# Altium schematic sheet FPGA_Core.SchDoc
size A4; SheetNumber: 3; SheetTotal: 5
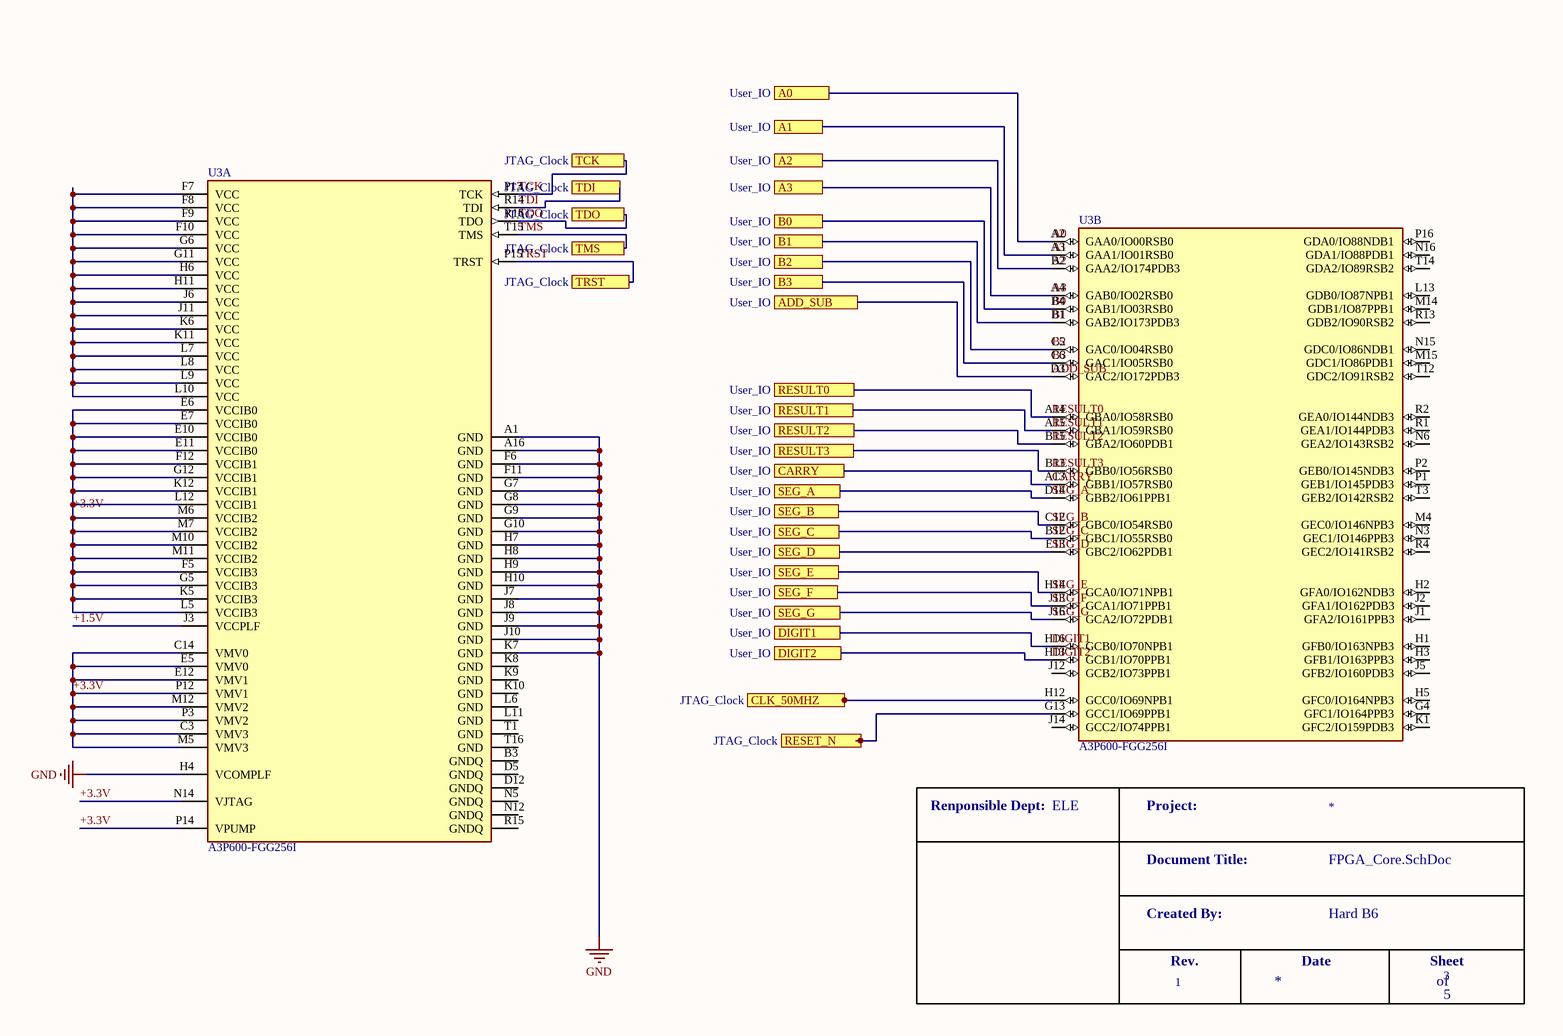
[diagram p0: FPGA_Core.SchDoc]

## Parts
*  HSHL Title Block  (value not drawn)  (graphical)
U3  A3P600-FGG256I  [FP-FG256-MFG]  (parts A,B of 4)

## Ports
A0 (see User_IO), A1 (see User_IO), A2 (see User_IO), A3 (see User_IO), ADD_SUB (see User_IO), B0 (see User_IO), B1 (see User_IO), B2 (see User_IO), B3 (see User_IO), CARRY (see User_IO), CLK_50MHZ (see JTAG_Clock), DIGIT1 (see User_IO), DIGIT2 (see User_IO), RESET_N (see JTAG_Clock), RESULT0 (see User_IO), RESULT1 (see User_IO), RESULT2 (see User_IO), RESULT3 (see User_IO), SEG_A (see User_IO), SEG_B (see User_IO), SEG_C (see User_IO), SEG_D (see User_IO), SEG_E (see User_IO), SEG_F (see User_IO), SEG_G (see User_IO), TCK (see JTAG_Clock), TDI (see JTAG_Clock), TDO (see JTAG_Clock), TMS (see JTAG_Clock), TRST (see JTAG_Clock)

## Nets
GND: U3.A1(GND) U3.A16(GND) U3.F6(GND) U3.F11(GND) U3.G7(GND) U3.G8(GND) U3.G9(GND) U3.G10(GND) U3.H4(VCOMPLF) U3.H7(GND) U3.H8(GND) U3.H9(GND) U3.H10(GND) U3.J7(GND) U3.J8(GND) U3.J9(GND) U3.J10(GND) U3.K7(GND)
+1.5V: U3.J3(VCCPLF)
+3.3V: U3.C3(VMV3) U3.C14(VMV0) U3.E5(VMV0) U3.E6(VCCIB0) U3.E7(VCCIB0) U3.E10(VCCIB0) U3.E11(VCCIB0) U3.E12(VMV1) U3.F5(VCCIB3) U3.F12(VCCIB1) U3.G5(VCCIB3) U3.G12(VCCIB1) U3.K5(VCCIB3) U3.K12(VCCIB1) U3.L5(VCCIB3) U3.L12(VCCIB1) U3.M5(VMV3) U3.M6(VCCIB2) U3.M7(VCCIB2) U3.M10(VCCIB2) U3.M11(VCCIB2) U3.M12(VMV2) U3.N14(VJTAG) U3.P3(VMV2) U3.P12(VMV1) U3.P14(VPUMP)
A0: U3.A2(GAA0/IO00RSB0) ; port A0
A1: U3.A3(GAA1/IO01RSB0) ; port A1
A2: U3.B2(GAA2/IO174PDB3) ; port A2
A3: U3.A4(GAB0/IO02RSB0) ; port A3
ADD_SUB: U3.D3(GAC2/IO172PDB3) ; port ADD_SUB
B0: U3.B4(GAB1/IO03RSB0) ; port B0
B1: U3.B1(GAB2/IO173PDB3) ; port B1
B2: U3.C5(GAC0/IO04RSB0) ; port B2
B3: U3.C6(GAC1/IO05RSB0) ; port B3
CARRY: U3.A13(GBB1/IO57RSB0) ; port CARRY
CLK_50MHZ: U3.H12(GCC0/IO69NPB1) ; port CLK_50MHZ
DIGIT1: U3.H16(GCB0/IO70NPB1) ; port DIGIT1
DIGIT2: U3.H13(GCB1/IO70PPB1) ; port DIGIT2
RESET_N: U3.G13(GCC1/IO69PPB1) ; port RESET_N
RESULT0: U3.A14(GBA0/IO58RSB0) ; port RESULT0
RESULT1: U3.A15(GBA1/IO59RSB0) ; port RESULT1
RESULT2: U3.B15(GBA2/IO60PDB1) ; port RESULT2
RESULT3: U3.B13(GBB0/IO56RSB0) ; port RESULT3
SEG_A: U3.D14(GBB2/IO61PPB1) ; port SEG_A
SEG_B: U3.C12(GBC0/IO54RSB0) ; port SEG_B
SEG_C: U3.B12(GBC1/IO55RSB0) ; port SEG_C
SEG_D: U3.E13(GBC2/IO62PDB1) ; port SEG_D
SEG_E: U3.H14(GCA0/IO71NPB1) ; port SEG_E
SEG_F: U3.J13(GCA1/IO71PPB1) ; port SEG_F
SEG_G: U3.J16(GCA2/IO72PDB1) ; port SEG_G
TCK: U3.P13(TCK) ; port TCK
TDI: U3.R14(TDI) ; port TDI
TDO: U3.R16(TDO) ; port TDO
TMS: U3.T15(TMS) ; port TMS
TRST: U3.P15(TRST) ; port TRST
NetU3_F7: U3.F7(VCC) U3.F8(VCC) U3.F9(VCC) U3.F10(VCC) U3.G6(VCC) U3.G11(VCC) U3.H6(VCC) U3.H11(VCC) U3.J6(VCC) U3.J11(VCC) U3.K6(VCC) U3.K11(VCC) U3.L7(VCC) U3.L8(VCC) U3.L9(VCC) U3.L10(VCC)

Not connected (* = marked no-connect by the designer): U3 B3(GNDQ) D5(GNDQ) D12(GNDQ) G4(GFC1/IO164PPB3) H1(GFB0/IO163NPB3) H2(GFA0/IO162NDB3) H3(GFB1/IO163PPB3) H5(GFC0/IO164NPB3) J1(GFA2/IO161PPB3) J2(GFA1/IO162PDB3) J5(GFB2/IO160PDB3) J12(GCB2/IO73PPB1) J14(GCC2/IO74PPB1) K1(GFC2/IO159PDB3) K8(GND) K9(GND) K10(GND) L6(GND) L11(GND) L13(GDB0/IO87NPB1) M4(GEC0/IO146NPB3) M14(GDB1/IO87PPB1) M15(GDC1/IO86PDB1) N3(GEC1/IO146PPB3) N5(GNDQ) N6(GEA2/IO143RSB2) N12(GNDQ) N15(GDC0/IO86NDB1) N16(GDA1/IO88PDB1) P1(GEB1/IO145PDB3) P2(GEB0/IO145NDB3) P16(GDA0/IO88NDB1) R1(GEA1/IO144PDB3) R2(GEA0/IO144NDB3) R4(GEC2/IO141RSB2) R13(GDB2/IO90RSB2) R15(GNDQ) T1(GND) T3(GEB2/IO142RSB2) T12(GDC2/IO91RSB2) T14(GDA2/IO89RSB2) T16(GND)

## Notes on the sheet
- DWG. NO.
- REV.
- SHT.
- THIS DOCUMENT AND THE DATA DISCLOSED HEREIN OR HEREWITH IS THE PROPERTY OF ALTIUM LIMITED AND MAY BE FREELY DISTRIBUTED IN WHOLE. NO RIGHTS ARE RESERVED OR EXPRESS OR IMPLIED WARANTEE GIVEN.
- REVISION
- DESCRIPTION
- DATE
- APPROVED
- ENG:
- APPROVALS
- PROJECT
- DSN:
- CHK:
- REFERENCE DOCUMENTS
- PROJECT REVISION:
- TITLE
- DOCUMENT REVISION:
- DESIGN ITEM:
- BOM:
- FAB DWG:
- PCB DWG:
- ASSY DWG:
- SCALE:
- SIZE
- B
- CAGE CODE
- FILE NAME
- DWG NO.
- SHEET
- OF
- REV
- (in symbol HSHL Title Block) Renponsible Dept:; ELE; Project:; Document Title:; Created By:; Hard B6; Rev.; Date; Sheet; 1; of

## Library data of the parts
U3 = CMP-00252-99164184-1: A3P600-FGG256I FPGA ProASIC®3 Family 600K Gates 231MHz 130nm (CMOS) Technology 1.5V 256-Pin FBGA; Number of Logic Elements/Cells: 6500; Min Supply Voltage: 1.4V; Memory Size: 13.5kB; Max Supply Voltage: 1.575V; Number of I/Os: 177; Max Junction Temperature (Tj): 100°C; Memory Type: RAM; Number of Gates: 600000; Operating Supply Current: 45mA; Number of Logic Blocks (LABs): 24; Nominal Supply Current: 5mA; Number of Registers: 13824; Number of Pins: 256; Max Operating Temperature: 85°C; Length: 17mm; Height: 1.2mm; Max Frequency: 231MHz; Operating Supply Voltage: 1.5V; Mount: Surface Mount; Min Operating Temperature: -40°C; Radiation Hardening: No; RAM Size: 13.5kB; Frequency: 231MHz; Case/Package: FBGA; Lead Free: Lead Free; Lifecycle Status: Production; Width: 17mm; NexarPartId: 99164184; RoHS: Compliant